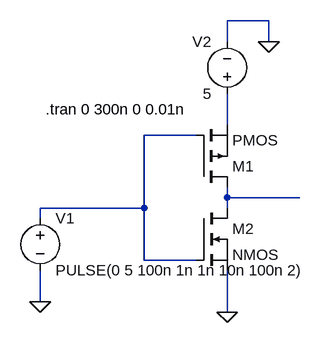
[diagram p0: schematic Draft1.asc]
Draft1.asc, the LTspice schematic file:
Version 4.1
SHEET 1 880 976
WIRE 464 -192 400 -192
WIRE 400 -160 400 -192
WIRE 464 -160 464 -192
WIRE 400 -32 400 -80
WIRE 352 -16 272 -16
WIRE 400 80 400 64
WIRE 512 80 400 80
WIRE 272 96 272 -16
WIRE 272 96 112 96
WIRE 400 96 400 80
WIRE 112 112 112 96
WIRE 272 176 272 96
WIRE 352 176 272 176
WIRE 112 240 112 192
WIRE 400 256 400 192
FLAG 464 -160 0
FLAG 112 240 0
FLAG 400 256 0
SYMBOL voltage 400 -64 R180
WINDOW 0 24 96 Left 2
WINDOW 3 24 16 Left 2
WINDOW 123 0 0 Left 0
WINDOW 39 0 0 Left 0
SYMATTR InstName V2
SYMATTR Value 5
SYMBOL voltage 112 96 R0
WINDOW 123 0 0 Left 0
WINDOW 39 0 0 Left 0
SYMATTR InstName V1
SYMATTR Value PULSE(0 5 100n 1n 1n 10n 100n 2)
SYMBOL pmos 352 64 M180
SYMATTR InstName M1
SYMBOL nmos 352 96 R0
SYMATTR InstName M2
TEXT 120 -56 Left 2 !.tran 0 300n 0 0.01n

The netlist it stands for:
* Draft1.asc
V2 N001 0 5
V1 N002 0 PULSE(0 5 100n 1n 1n 10n 100n 2)
M1 N003 N002 N001 N001 PMOS
M2 N003 N002 0 0 NMOS
.model NMOS NMOS
.model PMOS PMOS
.lib standard.mos
.tran 0 300n 0 0.01n
.backanno
.end